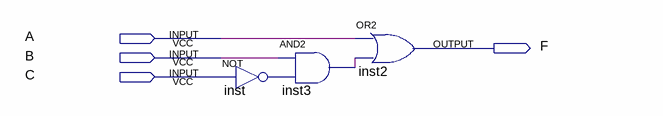
[diagram p0: schematic sheet]
// Quartus schematic Block1.bdf as structural Verilog: 3 symbols, 4 pins
module Block1 (
  input  A,
  input  B,
  input  C,
  output F
);

  wire inst3_out, inst_out;

  not inst (inst_out, C);
  and inst3 (inst3_out, B, inst_out);
  or inst2 (F, A, inst3_out);
endmodule
